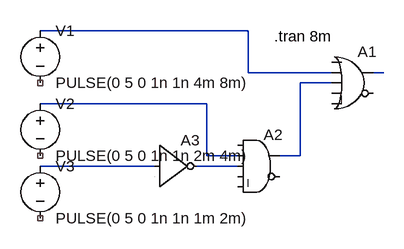
[diagram p0: schematic 11b.asc]
11b.asc, the LTspice schematic file:
Version 4.1
SHEET 1 880 680
WIRE 240 64 -80 64
WIRE 240 128 240 64
WIRE 368 128 240 128
WIRE 448 128 432 128
WIRE 368 144 320 144
WIRE 176 176 -80 176
WIRE 176 256 176 176
WIRE 224 256 176 256
WIRE 320 256 320 144
WIRE 320 256 288 256
WIRE 96 272 -80 272
WIRE 224 272 160 272
SYMBOL Digital\\and 256 208 R0
SYMATTR InstName A2
SYMBOL Digital\\inv 96 208 R0
SYMATTR InstName A3
SYMBOL voltage -80 48 R0
WINDOW 123 0 0 Left 0
WINDOW 39 0 0 Left 0
SYMATTR InstName V1
SYMATTR Value PULSE(0 5 0 1n 1n 4m 8m)
SYMBOL voltage -80 160 R0
WINDOW 123 0 0 Left 0
WINDOW 39 0 0 Left 0
SYMATTR InstName V2
SYMATTR Value PULSE(0 5 0 1n 1n 2m 4m)
SYMBOL voltage -80 256 R0
WINDOW 123 0 0 Left 0
WINDOW 39 0 0 Left 0
SYMATTR InstName V3
SYMATTR Value PULSE(0 5 0 1n 1n 1m 2m)
SYMBOL Digital\\or 400 80 R0
SYMATTR InstName A1
TEXT 280 72 Left 2 !.tran 8m

The netlist it stands for:
* 11b.asc
A2 0 N004 N006 0 0 0 N003 0 AND
A3 N005 0 0 0 0 N006 0 0 BUF
V1 N001 NC_01 PULSE(0 5 0 1n 1n 4m 8m)
V2 N004 NC_02 PULSE(0 5 0 1n 1n 2m 4m)
V3 N005 NC_03 PULSE(0 5 0 1n 1n 1m 2m)
A1 0 N001 N003 0 0 0 N002 0 OR
.tran 8m
.backanno
.end